# Altium project pwm-controller-board.PrjPcb
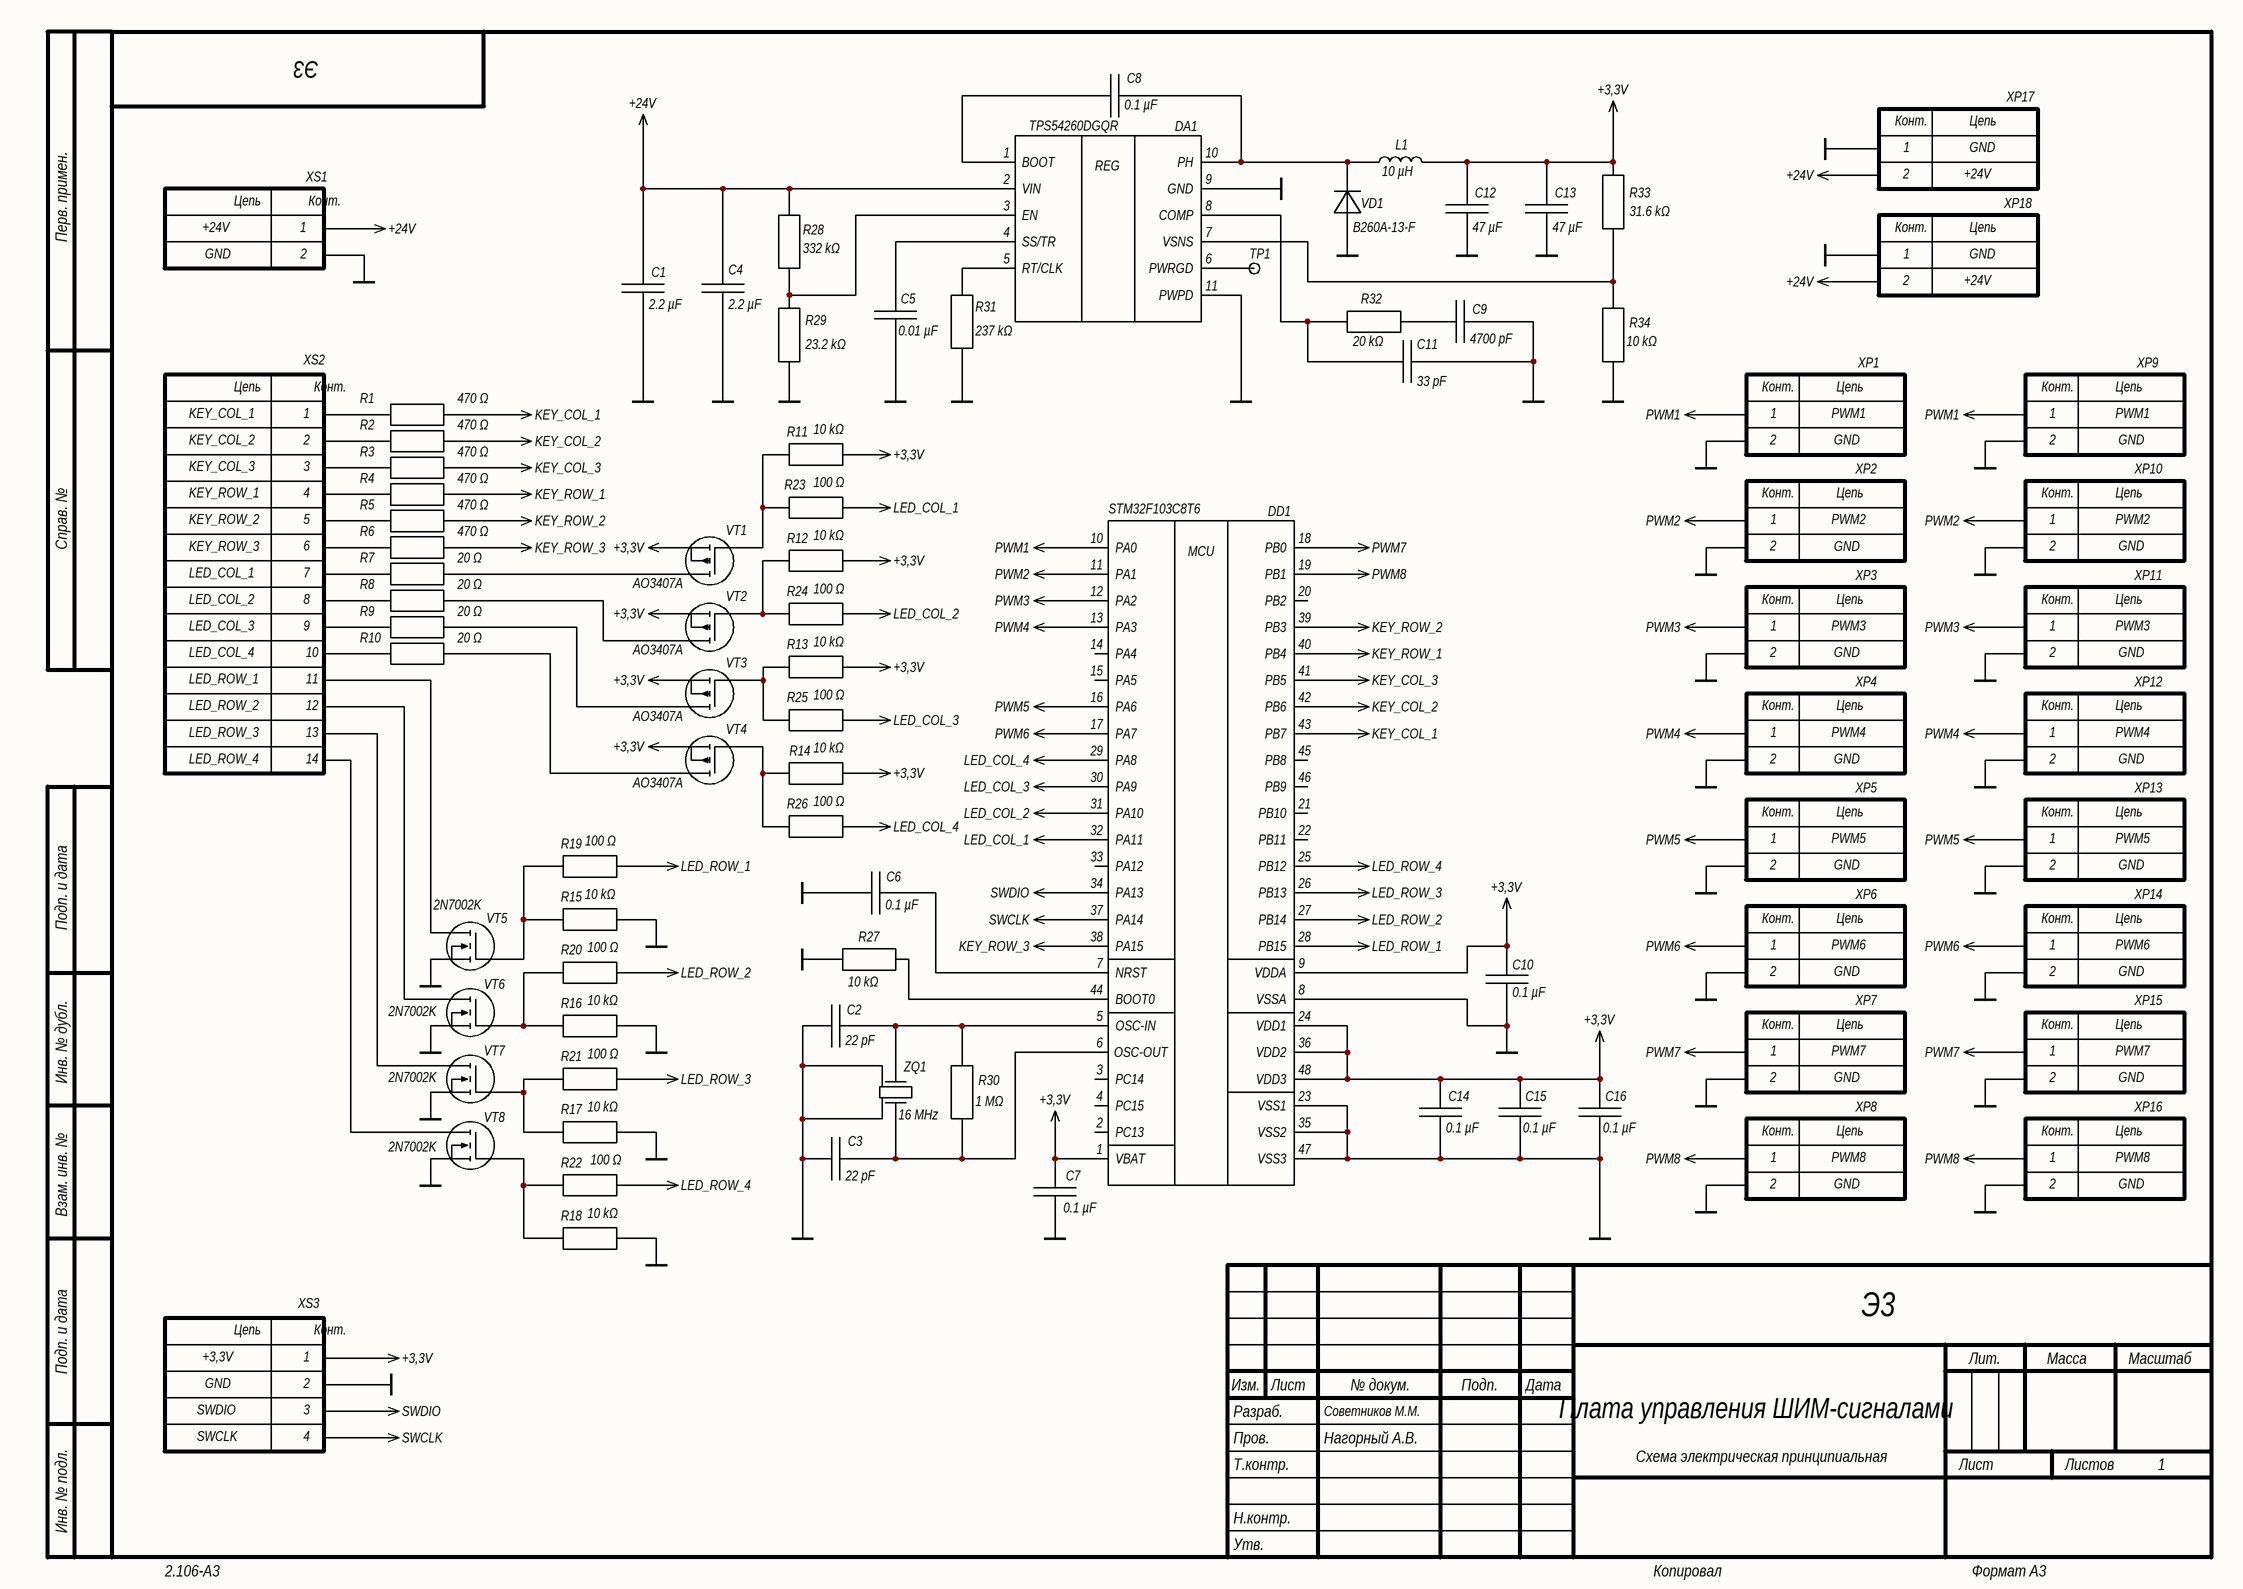
[diagram p0: pwm-controller-board_E3_schematic.SchDoc]
1 sheet, 85 parts. Net scope: global (net labels, ports and power ports of the same name join across sheets).
Board file: pwm-controller-board.PcbDoc

## Sheet pwm-controller-board_E3_schematic.SchDoc: Плата управления ШИМ-сигналами
size 420 x 297 mm; CheckedBy: Нагорный А.В.; Author: Советников М.М.; DocumentNumber: Э3; SheetNumber: 1; SheetTotal: 1; SheetType: Схема электрическая принципиальная; DocumentType: Схема электрическая принципиальная

### Parts
C1  2.2 µF  [C_1210]
C2  22 pF  [C_0603]
C3  22 pF  [C_0603]
C4  2.2 µF  [C_1210]
C5  0.01 µF  [C_0603]
C6  0.1 µF  [C_0603]
C7  0.1 µF  [C_0603]
C8  0.1 µF  [C_0603]
C9  4700 pF  [C_0603]
C10  0.1 µF  [C_0603]
C11  33 pF  [C_0603]
C12  47 µF  [C_0805]
C13  47 µF  [C_0805]
C14  0.1 µF  [C_0603]
C15  0.1 µF  [C_0603]
C16  0.1 µF  [C_0603]
DA1  TPS54260DGQR  [DA_HVSSOP-10_DGQ]
DD1  STM32F103C8T6  [DD_LQFP-48_STM32]
L1  10 µH  [L_MSS1260]
R1  470 Ω  [R_0603]
R2  470 Ω  [R_0603]
R3  470 Ω  [R_0603]
R4  470 Ω  [R_0603]
R5  470 Ω  [R_0603]
R6  470 Ω  [R_0603]
R7  20 Ω  [R_0603]
R8  20 Ω  [R_0603]
R9  20 Ω  [R_0603]
R10  20 Ω  [R_0603]
R11  10 kΩ  [R_0603]
R12  10 kΩ  [R_0603]
R13  10 kΩ  [R_0603]
R14  10 kΩ  [R_0603]
R15  10 kΩ  [R_0603]
R16  10 kΩ  [R_0603]
R17  10 kΩ  [R_0603]
R18  10 kΩ  [R_0603]
R19  100 Ω  [R_0603]
R20  100 Ω  [R_0603]
R21  100 Ω  [R_0603]
R22  100 Ω  [R_0603]
R23  100 Ω  [R_0603]
R24  100 Ω  [R_0603]
R25  100 Ω  [R_0603]
R26  100 Ω  [R_0603]
R27  10 kΩ  [R_0603]
R28  332 kΩ  [R_0603]
R29  23.2 kΩ  [R_0603]
R30  1 MΩ  [R_0603]
R31  237 kΩ  [R_0603]
R32  20 kΩ  [R_0603]
R33  31.6 kΩ  [R_0603]
R34  10 kΩ  [R_0603]
TP1  TestPoint  [TP_TestPoint]  (value not drawn)  (no BOM)
VD1  B260A-13-F  [VD_DO-214AC_SMA]
VT1  AO3407A  [VT_SOT-23]
VT2  AO3407A  [VT_SOT-23]
VT3  AO3407A  [VT_SOT-23]
VT4  AO3407A  [VT_SOT-23]
VT5  2N7002K  [VT_SOT-23]
VT6  2N7002K  [VT_SOT-23]
VT7  2N7002K  [VT_SOT-23]
VT8  2N7002K  [VT_SOT-23]
XP1  DS1066-02M  [X_DS1066_2Pin]  (value not drawn)
XP2  DS1066-02M  [X_DS1066_2Pin]  (value not drawn)
XP3  DS1066-02M  [X_DS1066_2Pin]  (value not drawn)
XP4  DS1066-02M  [X_DS1066_2Pin]  (value not drawn)
XP5  DS1066-02M  [X_DS1066_2Pin]  (value not drawn)
XP6  DS1066-02M  [X_DS1066_2Pin]  (value not drawn)
XP7  DS1066-02M  [X_DS1066_2Pin]  (value not drawn)
XP8  DS1066-02M  [X_DS1066_2Pin]  (value not drawn)
XP9  DS1066-02M  [X_DS1066_2Pin]  (value not drawn)
XP10  DS1066-02M  [X_DS1066_2Pin]  (value not drawn)
XP11  DS1066-02M  [X_DS1066_2Pin]  (value not drawn)
XP12  DS1066-02M  [X_DS1066_2Pin]  (value not drawn)
XP13  DS1066-02M  [X_DS1066_2Pin]  (value not drawn)
XP14  DS1066-02M  [X_DS1066_2Pin]  (value not drawn)
XP15  DS1066-02M  [X_DS1066_2Pin]  (value not drawn)
XP16  DS1066-02M  [X_DS1066_2Pin]  (value not drawn)
XP17  DS1069-2 M  [X_DS1069_2Pin]  (value not drawn)
XP18  DS1069-2 M  [X_DS1069_2Pin]  (value not drawn)
XS1  DG127-5.08-02P-14-1000  [X_DG127_2Pin_5.08mm]  (value not drawn)
XS2  DS-1022-1x14R  [X_DS1022_1x14R]  (value not drawn)
XS3  DS-1021-1x4  [X_DS1021_1x4]  (value not drawn)
ZQ1  16 MHz  [ZQ_2016_4Pin]

### Nets
+3,3V: C7.1 C10.1 C12.1 C13.1 C14.1 C15.1 C16.1 DD1.1(VBAT) DD1.9(VDDA) DD1.24(VDD1) DD1.36(VDD2) DD1.48(VDD3) L1.2 R11.1 R12.1 R13.1 R14.1 R33.2 VT1.S VT2.S VT3.S VT4.S XS3.1
+24V: C1.1 C4.1 DA1.2(VIN) R28.2 XP17.2 XP18.2 XS1.1
GND: C1.2 C2.1 C3.1 C4.2 C5.1 C6.1 C7.2 C9.1 C10.2 C11.2 C12.2 C13.2 C14.2 C15.2 C16.2 DA1.9(GND) DA1.11(PWPD) DD1.8(VSSA) DD1.23(VSS1) DD1.35(VSS2) DD1.47(VSS3) R15.1 R16.1 R17.1 R18.1 R27.1 R29.2 R31.1 R34.1 VD1.1 VT5.S VT6.S VT7.S VT8.S XP1.2 XP2.2 XP3.2 XP4.2 XP5.2 XP6.2 XP7.2 XP8.2 XP9.2 XP10.2 XP11.2 XP12.2 XP13.2 XP14.2 XP15.2 XP16.2 XP17.1 XP18.1 XS1.2 XS3.2 ZQ1.2 ZQ1.4
KEY_COL_1: DD1.43(PB7) R1.2
KEY_COL_2: DD1.42(PB6) R2.2
KEY_COL_3: DD1.41(PB5) R3.2
KEY_ROW_1: DD1.40(PB4) R4.2
KEY_ROW_2: DD1.39(PB3) R5.2
KEY_ROW_3: DD1.38(PA15) R6.2
LED_COL_1: DD1.32(PA11) R23.2
LED_COL_2: DD1.31(PA10) R24.2
LED_COL_3: DD1.30(PA9) R25.2
LED_COL_4: DD1.29(PA8) R26.2
LED_ROW_1: DD1.28(PB15) R19.2
LED_ROW_2: DD1.27(PB14) R20.2
LED_ROW_3: DD1.26(PB13) R21.2
LED_ROW_4: DD1.25(PB12) R22.2
PWM1: DD1.10(PA0) XP1.1 XP9.1
PWM2: DD1.11(PA1) XP2.1 XP10.1
PWM3: DD1.12(PA2) XP3.1 XP11.1
PWM4: DD1.13(PA3) XP4.1 XP12.1
PWM5: DD1.16(PA6) XP5.1 XP13.1
PWM6: DD1.17(PA7) XP6.1 XP14.1
PWM7: DD1.18(PB0) XP7.1 XP15.1
PWM8: DD1.19(PB1) XP8.1 XP16.1
SWCLK: DD1.37(PA14) XS3.4
SWDIO: DD1.34(PA13) XS3.3
NetC2_2: C2.2 DD1.5(OSC-IN) R30.2 ZQ1.1
NetC3_2: C3.2 DD1.6(OSC-OUT) R30.1 ZQ1.3
NetC5_2: C5.2 DA1.4(SS/TR)
NetC6_2: C6.2 DD1.7(NRST)
NetC8_1: C8.1 DA1.10(PH) L1.1 VD1.2
NetC8_2: C8.2 DA1.1(BOOT)
NetC9_2: C9.2 R32.1
NetC11_1: C11.1 DA1.8(COMP) R32.2
NetDA1_3: DA1.3(EN) R28.1 R29.1
NetDA1_5: DA1.5(RT/CLK) R31.2
NetDA1_6: DA1.6(PWRGD) TP1.1
NetDA1_7: DA1.7(VSNS) R33.1 R34.2
NetDD1_44: DD1.44(BOOT0) R27.2
NetR1_1: R1.1 XS2.1
NetR2_1: R2.1 XS2.2
NetR3_1: R3.1 XS2.3
NetR4_1: R4.1 XS2.4
NetR5_1: R5.1 XS2.5
NetR6_1: R6.1 XS2.6
NetR7_1: R7.1 XS2.7
NetR7_2: R7.2 VT1.D
NetR8_1: R8.1 XS2.8
NetR8_2: R8.2 VT2.D
NetR9_1: R9.1 XS2.9
NetR9_2: R9.2 VT3.D
NetR10_1: R10.1 XS2.10
NetR10_2: R10.2 VT4.D
NetR11_2: R11.2 R23.1 VT1.G
NetR12_2: R12.2 R24.1 VT2.G
NetR13_2: R13.2 R25.1 VT3.G
NetR14_2: R14.2 R26.1 VT4.G
NetR15_2: R15.2 R19.1 VT5.G
NetR16_2: R16.2 R20.1 VT6.G
NetR17_2: R17.2 R21.1 VT7.G
NetR18_2: R18.2 R22.1 VT8.G
NetVT5_D: VT5.D XS2.11
NetVT6_D: VT6.D XS2.12
NetVT7_D: VT7.D XS2.13
NetVT8_D: VT8.D XS2.14

Not connected (* = marked no-connect by the designer): DD1 2(PC13) 3(PC14) 4(PC15) 14(PA4) 15(PA5) 20(PB2) 21(PB10) 22(PB11) 33(PA12) 45(PB8) 46(PB9)

### Notes on the sheet
- +24V
- GND
- KEY_COL_1
- KEY_COL_2
- PWM1
- KEY_COL_3
- KEY_ROW_1
- KEY_ROW_2
- PWM2
- KEY_ROW_3
- LED_COL_1
- LED_COL_2
- LED_COL_3
- LED_COL_4
- PWM3
- LED_ROW_1
- LED_ROW_2
- LED_ROW_3
- LED_ROW_4
- PWM4
- PWM5
- PWM6
- PWM7
- PWM8
- +3,3V
- SWDIO
- SWCLK
- Перв. примен.
- Справ. №
- Подп. и дата
- Инв. № дубл.
- Взам. инв. №
- Разраб.
- Изм.
- Лист
- № докум.
- Подп.
- Дата
- Лит.
- Масса
- Масштаб
- Пров.
- Т.контр.
- Листов
- 1
- Инв. № подл.
- Утв.
- Н.контр.
- 2.106-A3
- Копировал
- Формат А3
- (in symbol DA_TPS54260) REG
- (in symbol DD_STM32_LQFP48) MCU
- (in symbol XP_Connector_2Pin_DS1066) Конт.; Цепь
- (in symbol XP_Connector_2Pin_DS1069) Конт.; Цепь
- (in symbol XS_Connector_4Pin) Цепь; Конт.
- (in symbol XS_Connector_14Pin) Цепь; Конт.
- (in symbol XS_TerminalBlock_2Pin) Цепь; Конт.

### Library data of the parts
C1 C4 = C_NonPolarized: Non-polarized capacitor; Manufacturer: Yageo; Part Number: CC1210KKX7R0BB225; Value: 2.2 µF; Case: 1210; Case Type: SMD
C2 C3 = C_NonPolarized: Non-polarized capacitor; Manufacturer: Murata; Part Number: GRM1885C1H220JA01D; Value: 22 pF; Case: 0603; Case Type: SMD
C5 = C_NonPolarized: Non-polarized capacitor; Manufacturer: Murata; Part Number: GRM1885C1H103JA01D; Value: 0.01 µF; Case: 0603; Case Type: SMD
C6-C8 C10 C14-C16 = C_NonPolarized: Non-polarized capacitor; Manufacturer: Murata; Part Number: GRM188R72A104KA35D; Value: 0.1 µF; Case: 0603; Case Type: SMD
C9 = C_NonPolarized: Non-polarized capacitor; Manufacturer: Murata; Part Number: GRM1885C1H472JA01D; Value: 4700 pF; Case: 0603; Case Type: SMD
C11 = C_NonPolarized: Non-polarized capacitor; Manufacturer: Murata; Part Number: GRM1885C1H330JA01D; Value: 33 pF; Case: 0603; Case Type: SMD
C12 C13 = C_NonPolarized: Non-polarized capacitor; Manufacturer: Murata; Part Number: GRM21BR61A476ME15L; Value: 47 µF; Case: 0805; Case Type: SMD
DA1 = DA_TPS54260: TPS54260 step-down switching regulator, HVSSOP-10; Manufacturer: TI; Part Number: TPS54260DGQR; Value: TPS54260DGQR; Case: HVSSOP (DGQ) | 10; Case Type: SMD
DD1 = DD_STM32_LQFP48: STM32 microcontroller, LQFP-48 package; Manufacturer: ST; Case: LQFP48; Case Type: SMD; Part Number: STM32F103C8T6; Value: STM32F103C8T6
L1 = L_Inductor: Inductor; Manufacturer: Coilcraft; Part Number: MSS1260-103MLD; Value: 10 µH; Case: 12.00mm x 12.00mm; Case Type: SMD
R1-R6 = R_Resistor: Fixed resistor; Manufacturer: Yageo; Part Number: RC0603FR-07470RL; Value: 470 Ω; Case: 0603; Case Type: SMD
R7-R10 = R_Resistor: Fixed resistor; Manufacturer: Yageo; Part Number: RC0603FR-0720RL; Value: 20 Ω; Case: 0603; Case Type: SMD
R11-R18 R27 R34 = R_Resistor: Fixed resistor; Manufacturer: Yageo; Part Number: RC0603FR-0710KL; Value: 10 kΩ; Case: 0603; Case Type: SMD
R19-R26 = R_Resistor: Fixed resistor; Manufacturer: Yageo; Part Number: RC0603FR-07100RL; Value: 100 Ω; Case: 0603; Case Type: SMD
R28 = R_Resistor: Fixed resistor; Manufacturer: Yageo; Part Number: RC0603FR-07332KL; Value: 332 kΩ; Case: 0603; Case Type: SMD
R29 = R_Resistor: Fixed resistor; Manufacturer: Yageo; Part Number: RC0603FR-0723K2L; Value: 23.2 kΩ; Case: 0603; Case Type: SMD
R30 = R_Resistor: Fixed resistor; Manufacturer: Yageo; Part Number: RC0603FR-071ML; Value: 1 MΩ; Case: 0603; Case Type: SMD
R31 = R_Resistor: Fixed resistor; Manufacturer: Yageo; Part Number: RC0603FR-07237KL; Value: 237 kΩ; Case: 0603; Case Type: SMD
R32 = R_Resistor: Fixed resistor; Manufacturer: Yageo; Part Number: RC0603FR-0720KL; Value: 20 kΩ; Case: 0603; Case Type: SMD
R33 = R_Resistor: Fixed resistor; Manufacturer: Yageo; Part Number: RC0603FR-0731K6L; Value: 31.6 kΩ; Case: 0603; Case Type: SMD
TP1 = TP_TestPoint: Test point; Value: TestPoint
VD1 = VD_Schottky: Schottky diode; pin 1 anode, pin 2 cathode; Manufacturer: Diodes Incorporated; Part Number: B260A-13-F; Value: B260A-13-F; Case: DO-214AC, SMA; Case Type: SMD
VT1-VT4 = VT_MOSFET-P: P-channel MOSFET; pins G gate, S source, D drain; Manufacturer: Youtai; Part Number: AO3407A; Value: AO3407A; Case: SOT-23-3; Case Type: SMD
VT5-VT8 = VT_MOSFET-N: N-channel MOSFET; pins G gate, S source, D drain; Manufacturer: Hottech; Part Number: 2N7002K; Value: 2N7002K; Case: SOT-23 (TO-236AB); Case Type: SMD
XP1-XP16 = XP_Connector_2Pin_DS1066: 2-pin connector, DS1066 series; Manufacturer: Connfly; Case: 5.8 x 4.8; Case Type: THT; Part Number: DS1066-02M; Value: DS1066-02M
XP17 XP18 = XP_Connector_2Pin_DS1069: 2-pin connector, DS1069 series; Manufacturer: Connfly; Case: 7.5 x 5.75; Case Type: THT; Part Number: DS1069-2 M; Value: DS1069-2 M
XS1 = XS_TerminalBlock_2Pin: 2-pin screw terminal block; Manufacturer: Degson; Part Number: DG127-5.08-02P-14-1000; Value: DG127-5.08-02P-14-1000; Case: 10.8 x 8.2; Case Type: THT
XS2 = XS_Connector_14Pin: 14-pin connector; Manufacturer: Connfly; Case: PLS-14R; Case Type: THT; Part Number: DS-1022-1x14R; Value: DS-1022-1x14R
XS3 = XS_Connector_4Pin: 4-pin connector; Manufacturer: Connfly; Case: PLS-4; Case Type: THT; Part Number: DS-1021-1x4; Value: DS-1021-1x4
ZQ1 = ZQ_Crystal: Quartz crystal; pins 1/3 crystal, 2/4 metal case; Manufacturer: CTS; Part Number: 402WF16012ILR; Value: 16 MHz; Case: 2.0 x 1.6 mm; Case Type: SMD